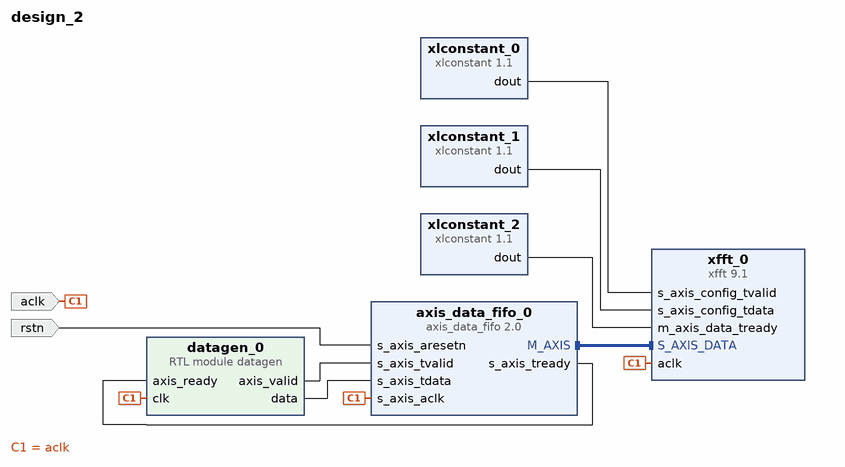
[diagram p0: block diagram of the top level]
# Vivado block design design_2, xczu4ev-sfvc784-1-i, Vivado 2022.1
create_bd_design design_2

create_bd_port -dir I -type clk aclk
create_bd_port -dir I -type rst rstn

create_bd_cell -type ip -vlnv xilinx.com:ip:xfft:9.1 xfft_0
set_property -dict [list \
  CONFIG.complex_mult_type use_mults_performance \
  CONFIG.implementation_options radix_4_burst_io \
  CONFIG.memory_options_data block_ram \
  CONFIG.memory_options_hybrid false \
  CONFIG.memory_options_phase_factors block_ram \
  CONFIG.memory_options_reorder block_ram \
  CONFIG.number_of_stages_using_block_ram_for_data_and_phase_factors 0 \
  CONFIG.output_ordering natural_order \
  CONFIG.phase_factor_width 16 \
  CONFIG.rounding_modes convergent_rounding \
  CONFIG.scaling_options unscaled \
  CONFIG.target_clock_frequency 250 \
  CONFIG.throttle_scheme nonrealtime \
  CONFIG.xk_index true \
] [get_bd_cells xfft_0]
create_bd_cell -type ip -vlnv xilinx.com:ip:axis_data_fifo:2.0 axis_data_fifo_0
set_property -dict [list \
  CONFIG.FIFO_DEPTH 2048 \
  CONFIG.HAS_RD_DATA_COUNT 1 \
  CONFIG.HAS_WR_DATA_COUNT 1 \
  CONFIG.TDATA_NUM_BYTES 4 \
] [get_bd_cells axis_data_fifo_0]
create_bd_cell -type ip -vlnv xilinx.com:ip:xlconstant:1.1 xlconstant_0
create_bd_cell -type ip -vlnv xilinx.com:ip:xlconstant:1.1 xlconstant_1
set_property -dict {CONFIG.CONST_WIDTH 8} [get_bd_cells xlconstant_1]
create_bd_cell -type module -reference datagen datagen_0
create_bd_cell -type ip -vlnv xilinx.com:ip:xlconstant:1.1 xlconstant_2
set_property -dict {CONFIG.CONST_VAL 0} [get_bd_cells xlconstant_2]

# ---- connections ----

connect_bd_intf_net [get_bd_intf_pins axis_data_fifo_0/M_AXIS] [get_bd_intf_pins xfft_0/S_AXIS_DATA]
connect_bd_net [get_bd_pins axis_data_fifo_0/s_axis_tready] [get_bd_pins datagen_0/axis_ready]
connect_bd_net [get_bd_pins datagen_0/axis_valid] [get_bd_pins axis_data_fifo_0/s_axis_tvalid]
connect_bd_net [get_bd_pins datagen_0/data] [get_bd_pins axis_data_fifo_0/s_axis_tdata]
connect_bd_net -net s_axis_aclk_0_1 [get_bd_ports aclk] \
  [get_bd_pins axis_data_fifo_0/s_axis_aclk] [get_bd_pins xfft_0/aclk] [get_bd_pins datagen_0/clk]
connect_bd_net -net s_axis_aresetn_0_1 [get_bd_ports rstn] [get_bd_pins axis_data_fifo_0/s_axis_aresetn]
connect_bd_net [get_bd_pins xlconstant_0/dout] [get_bd_pins xfft_0/s_axis_config_tvalid]
connect_bd_net [get_bd_pins xlconstant_1/dout] [get_bd_pins xfft_0/s_axis_config_tdata]
connect_bd_net [get_bd_pins xlconstant_2/dout] [get_bd_pins xfft_0/m_axis_data_tready]

validate_bd_design
save_bd_design
